# Altium project Carrier-Board-v1.0.PrjPcb (part 2 of 9)

## Sheet 03-CAN2_SPI_CAN_CONTROLLER.SchDoc
size A4; SheetNumber: 4; SheetTotal: 20
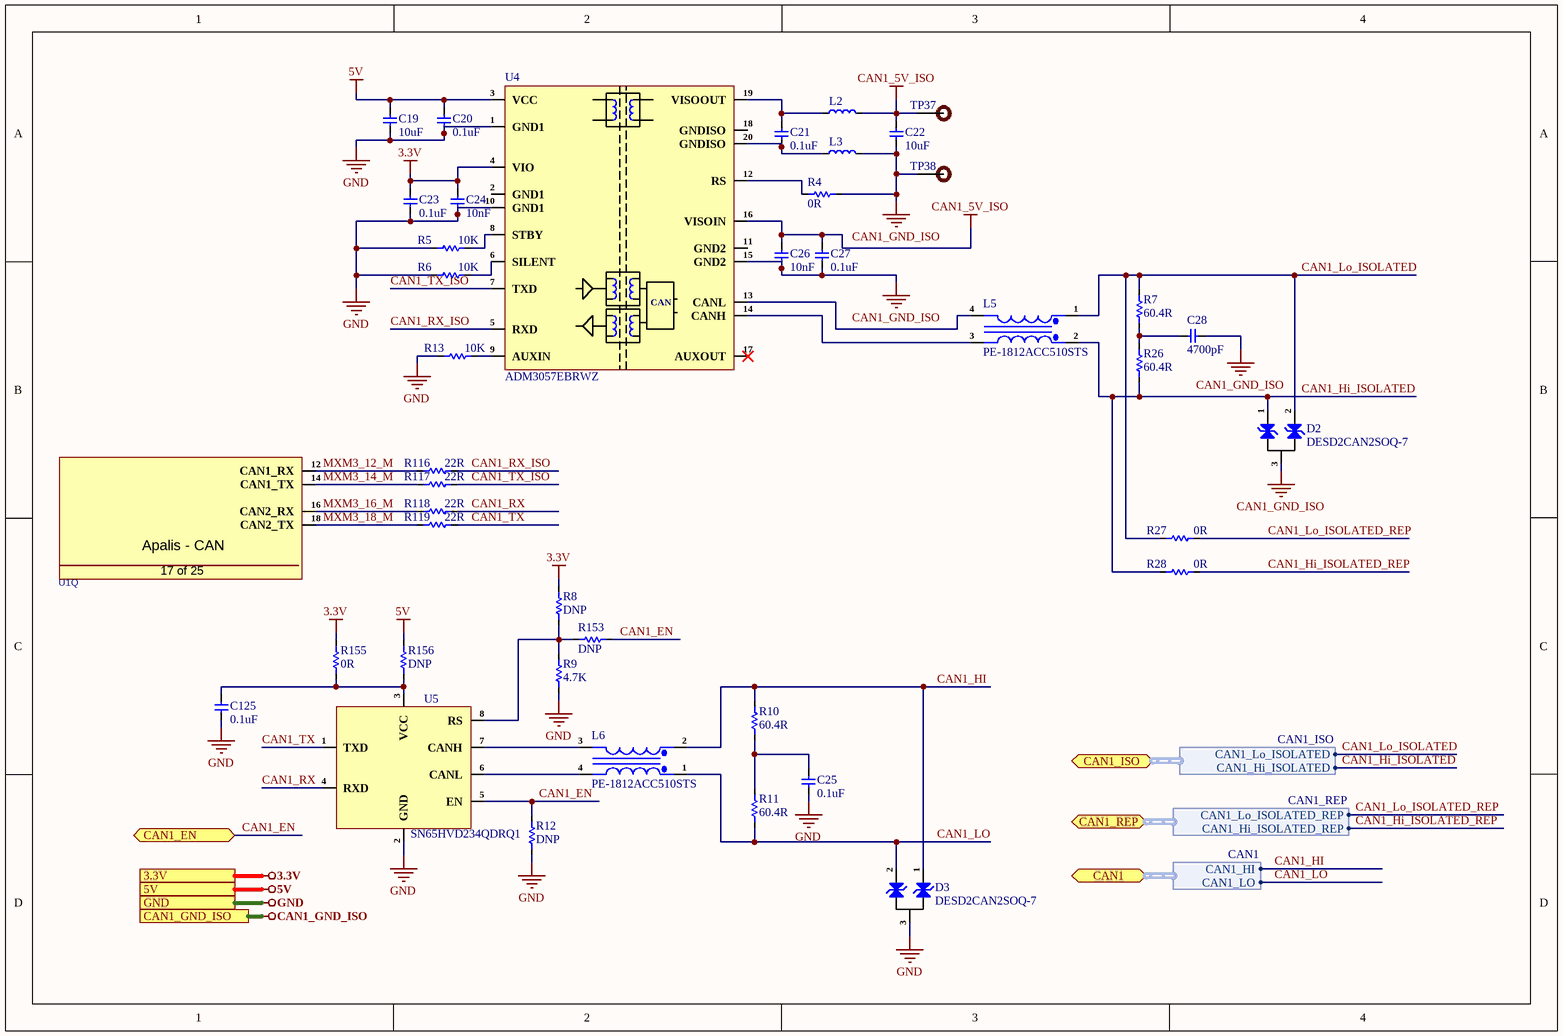
[diagram p3: 03-CAN2_SPI_CAN_CONTROLLER.SchDoc]

### Parts
C19  10uF  [Cap-0603]
C20  0.1uF  [Cap-0402]
C21  0.1uF  [Cap-0402]
C22  10uF  [Cap-0603]
C23  0.1uF  [Cap-0402]
C24  10nF  [Cap-0402]
C25  0.1uF  [Cap-0402]
C26  10nF  [Cap-0402]
C27  0.1uF  [Cap-0402]
C28  4700pF  [Cap-1206]
C125  0.1uF  [Cap-0402]
D2  DESD2CAN2SOQ-7  [SOT-23]
D3  DESD2CAN2SOQ-7  [SOT-23]
L2  BLM15HD182SN1D  [IND-0402]  (value not drawn)
L3  BLM15HD182SN1D  [IND-0402]  (value not drawn)
L5  PE-1812ACC510STS  [PE-1812ACC510STS]
L6  PE-1812ACC510STS  [PE-1812ACC510STS]
R4  0R  [Res-0402]
R5  10K  [Res-0603]
R6  10K  [Res-0603]
R7  60.4R  [Res-0603]
R8  DNP  [Res-0603]
R9  4.7K  [Res-0603]
R10  60.4R  [Res-0603]
R11  60.4R  [Res-0603]
R12  DNP  [Res-0603]
R13  10K  [Res-0603]
R26  60.4R  [Res-0603]
R27  0R  [Res-0603]
R28  0R  [Res-0603]
R116  22R  [Res-0402]
R117  22R  [Res-0402]
R118  22R  [Res-0402]
R119  22R  [Res-0402]
R153  DNP  [Res-0402]
R155  0R  [Res-0603]
R156  DNP  [Res-0603]
TP37  DNP  [Test-point]  (value not drawn)
TP38  DNP  [Test-point]  (value not drawn)
U1  MM70-314B1-2-R300  [MM70-314B1-2-R300]  (value not drawn)  (part Q of 25)
U4  ADM3057EBRWZ  [20-SOIC]
U5  SN65HVD234QDRQ1  [SOIC-8]

### Ports
3.3V (see Top_Sheet[1B], APALIS_POWER_SUPPLY[1D], CAN2_SPI_CAN_CONTROLLER[1D], DC_DC_CONVERTER[1D], GPIO_NC_INTERFACE[4B], I2C_INTERFACE[1B], LTE_MODULE[1D], Reset_and_SDIO[1D]), 5V (see Top_Sheet[1B], CAN2_SPI_CAN_CONTROLLER[1D], DC_DC_CONVERTER[1D]), CAN1 (bidir, harness CAN1, see Top_Sheet[1B], CONNECTORS[2C]), CAN1_EN (bidir, see Top_Sheet[1B], GPIO_NC_INTERFACE[3D]), CAN1_GND_ISO (see Top_Sheet[1B], CONNECTORS[1D]), CAN1_ISO (bidir, harness CAN1_ISO, see Top_Sheet[1B], CONNECTORS[3B]), CAN1_REP (bidir, harness CAN1_REP, see Top_Sheet[1B], CONNECTORS[3C]), GND (see Top_Sheet[1B], APALIS_POWER_SUPPLY[1D], CAN2_SPI_CAN_CONTROLLER[1D], CODEC_INTERFACE[1D], CONNECTORS[1D], DC_DC_CONVERTER[1D], DIGITAL_I-O_O-P[1D], ETHERNET_INTERFACE[1D], FUTURE_USE_CONNECTOR[1D], GPIO_NC_INTERFACE[4B], HDMI_INTERFACE[1D], I2C_INTERFACE[1B], INPUT_SUPPLY_PROTECTION[1D], LTE_MODULE[1D], MECHANICAL_FOR_PCB[1D], MICRO_SD_CARD_INTERFACE[1D], Reset_and_SDIO[1D], UART_INTERFACE[1D], USB3.0_INTERFACE[1D])

### Harnesses
CAN1_ISO: CAN1_Lo_ISOLATED, CAN1_Hi_ISOLATED
CAN1_REP: CAN1_Lo_ISOLATED_REP, CAN1_Hi_ISOLATED_REP
CAN1: CAN1_HI, CAN1_LO

### Nets
3.3V: C23.2 C24.2 R8.2 R155.2 U4.4(VIO) ; port 3.3V
5V: C19.2 C20.2 R156.2 U4.3(VCC) ; port 5V
CAN1_5V_ISO: C22.2 C26.2 C27.2 L2.2 TP37.1 U4.16(VISOIN)
CAN1_GND_ISO: C22.1 C26.1 C27.1 C28.2 D2.3 L3.2 R4.2 TP38.1 U4.15(GND2) ; port CAN1_GND_ISO
GND: C19.1 C20.1 C23.1 C24.1 C25.1 C125.1 D3.3 R5.1 R6.1 R9.1 R12.1 R13.1 U4.1(GND1) U4.10(GND1) U5.2(GND) ; port GND
CAN1_EN: R12.2 R153.2 U5.5(EN) ; port CAN1_EN
CAN1_HI: D3.1 L6.2 R10.2 ; port CAN1.CAN1_HI  [project net CAN1.CAN1_HI]
CAN1_Hi_ISOLATED: D2.1 L5.2 R26.1 R28.2 ; port CAN1_ISO.CAN1_Hi_ISOLATED
CAN1_Hi_ISOLATED_REP: R28.1 ; port CAN1_REP.CAN1_Hi_ISOLATED_REP
CAN1_LO: D3.2 L6.1 R11.1 ; port CAN1.CAN1_LO  [project net CAN1.CAN1_LO]
CAN1_Lo_ISOLATED: D2.2 L5.1 R7.2 R27.2 ; port CAN1_ISO.CAN1_Lo_ISOLATED  [project net CAN1_ISO.CAN1_Lo_ISOLATED]
CAN1_Lo_ISOLATED_REP: R27.1 ; port CAN1_REP.CAN1_Lo_ISOLATED_REP
CAN1_RX: R118.2 U5.4(RXD)
CAN1_RX_ISO: R116.2 U4.5(RXD)
CAN1_TX: R119.2 U5.1(TXD)
CAN1_TX_ISO: R117.2 U4.7(TXD)
MXM3_12_M: R116.1 U1.12(CAN1_RX)
MXM3_14_M: R117.1 U1.14(CAN1_TX)
MXM3_16_M: R118.1 U1.16(CAN2_RX)
MXM3_18_M: R119.1 U1.18(CAN2_TX)
NetC21_1: C21.1 L3.1 U4.20(GNDISO)
NetC21_2: C21.2 L2.1 U4.19(VISOOUT)
NetC25_2: C25.2 R10.1 R11.2
NetC28_1: C28.1 R7.1 R26.2
NetC125_2: C125.2 R155.1 R156.1 U5.3(VCC)
NetL5_3: L5.3 U4.14(CANH)
NetL5_4: L5.4 U4.13(CANL)
NetL6_3: L6.3 U5.7(CANH)
NetL6_4: L6.4 U5.6(CANL)
NetR4_1: R4.1 U4.12(RS)
NetR5_2: R5.2 U4.8(STBY)
NetR6_2: R6.2 U4.6(SILENT)
NetR8_1: R8.1 R9.2 R153.1 U5.8(RS)
NetR13_2: R13.2 U4.9(AUXIN)

Not connected (* = marked no-connect by the designer): U4 2(GND1) 11(GND2) 17(AUXOUT)* 18(GNDISO)

### Notes on the sheet
- (in symbol ADM3057EBRWZ) CAN
- (in symbol MM70-314B1-2-R300, part Q) Apalis - CAN; 17 of 25

### Library data of the parts
C19 C22 = GRM188R61A106KE69D: CAP CER 10UF 10V X5R 0603; Manufacturer: Murata; Tolerance: 10%; Item Type: Capacitor; Supplier: Future Electronics; Supplier Part Number: 1008140; Manufacturer Part Number: GRM188R61A106KE69D; RoHS: Yes; Category: Ceramic Capacitors; Stock: 36000; Pricing: 4000=0.0237, 12000=0.0228, 20000=0.0224, 60000=0.0216, 100000=0.0209 (USD); Mounting Technology: Surface Mount; Case/Package: 0603; Case Code (Metric): 1608; Case Code (Imperial): 0603; Min Operating Temperature: -55°C; Max Operating Temperature: 85°C; Value: 10uF; Packaging: Cut Tape; Dielectric: X5R; Voltage Rating: 10V; Voltage: 10V; Voltage Rating (DC): 10V; Series: GRM; Length: 0.063inch; Width: 0.031inch; Height: 0.8mm; Thickness: 0.037inch; Depth: 0.8mm; Reach SVHC Compliant: No; Lead Free: Lead Free; RoHS Compliant: Yes; ComponentLink1URL: http://www.farnell.com/datasheets/1955682.pdf?src-supplier=Farnell; ComponentLink1Description: http://www.farnell.com/datasheets/1955682.pdf?src-supplier=Farnell; ComponentLink2URL: http://www.mouser.com/ds/2/281/c02e-2905.pdf?src-supplier=Mouser; ComponentLink2Description: http://www.mouser.com/ds/2/281/c02e-2905.pdf?src-supplier=Mouser; ComponentLink3URL: http://www.farnell.com/datasheets/1955682.pdf?src-supplier=Newark; ComponentLink3Description: http://www.farnell.com/datasheets/1955682.pdf?src-supplier=Newark; ComponentLink4URL: http://www.farnell.com/datasheets/1955682.pdf?src-supplier=Element14; ComponentLink4Description: http://www.farnell.com/datasheets/1955682.pdf?src-supplier=Element14; ComponentLink5URL: https://datasheet.octopart.com/GRM188R61A106KE69D-Murata-datasheet-46741888.pdf?src-supplier=Element14; ComponentLink5Description: https://datasheet.octopart.com/GRM188R61A106KE69D-Murata-datasheet-46741888.pdf?src-supplier=Element14; ComponentLink6URL: http://search.murata.co.jp/Ceramy/image/img/A01X/G101/ENG/GRM188R61A106KE69-01.pdf?src-supplier=Digi-Key; ComponentLink6Description: http://search.murata.co.jp/Ceramy/image/img/A01X/G101/ENG/GRM188R61A106KE69-01.pdf?src-supplier=Digi-Key; ComponentLink7URL: http://psearch.en.murata.com/capacitor/product/GRM188R61A106KE69%23.pdf?src-supplier=Avnet; ComponentLink7Description: http://psearch.en.murata.com/capacitor/product/GRM188R61A106KE69%23.pdf?src-supplier=Avnet
C20 C21 C23 C25 C27 C125 = C0402C104K4REC7867: as C7 on sheet APALIS_POWER_SUPPLY; Supplier: Digi-Key; Supplier Part Number: 399-C0402C104K4REC7867CT-ND; Manufacturer Part Number: C0402C104K4REC7867; RoHS: No; Category: Ceramic Capacitors; Stock: 10918; Pricing: 1=0.1, 10=0.072, 50=0.0408, 100=0.0338, 500=0.02372, 1000=0.01963, 2500=0.01827, 5000=0.01672 (USD)
C24 C26 = C0402C103K5RAC7411: as C13 on sheet APALIS_POWER_SUPPLY; Supplier: Mouser; Supplier Part Number: 80-C0402C103K5R7411; Manufacturer Part Number: C0402C103K5RAC7411; RoHS: Yes; Category: Ceramic Capacitors; Stock: 440672; Pricing: 1=0.1, 10=0.017, 50=0.017, 100=0.009, 1000=0.005, 10000=0.004 (USD); Mounting Technology: Surface Mount; Case/Package: 0402; Min Operating Temperature: -55°C; Max Operating Temperature: 125°C; Value: 10nF; Dielectric: X7R; Voltage Rating (DC): 50V; Construction: Flat; Length: 1mm; Height: 0.5mm; Depth: 0.5mm; Radiation Hardening: No; RoHS Compliant: Yes; ComponentLink1URL: http://capacitoredge.kemet.com/capedge2/DataSheet?pn=C0402C103K5RAC7411&src-supplier=Avnet; ComponentLink1Description: http://capacitoredge.kemet.com/capedge2/DataSheet?pn=C0402C103K5RAC7411&src-supplier=Avnet
C28 = C1206C472K5RACAUTO: as C15 on sheet CAN2_SPI_CAN_CONTROLLER; Supplier: Mouser; Supplier Part Number: 80-C1206C472K5RAUTO; Manufacturer Part Number: C1206C472K5RACAUTO; RoHS: Yes; Category: Ceramic Capacitors; Stock: 3869; Pricing: 1=0.18, 10=0.075, 50=0.075, 100=0.044, 1000=0.036, 10000=0.028 (USD); ComponentLink1URL: https://datasheet.ciiva.com/6259/datasheetpn-c1206c472k5racauto-6259849.pdf?src-supplier=Digi-Key; ComponentLink1Description: https://datasheet.ciiva.com/6259/datasheetpn-c1206c472k5racauto-6259849.pdf?src-supplier=Digi-Key
D2 D3 = DESD2CAN2SOQ-7: as D1 on sheet CAN2_SPI_CAN_CONTROLLER; Supplier: Future Electronics; Supplier Part Number: 5053887; Manufacturer Part Number: DESD2CAN2SOQ-7; RoHS: Yes; Category: TVS Diodes; Stock: 18000; Pricing: 3000=0.109, 6000=0.107, 12000=0.105, 15000=0.104, 45000=0.101 (USD); Mounting Technology: Surface Mount; Case/Package: TO-236-3; Min Operating Temperature: -65°C; Max Operating Temperature: 150°C; Packaging: Cut Tape; Series: Automotive, AEC-Q101; RoHS Compliant: Yes; ComponentLink1URL: http://www.farnell.com/datasheets/2814365.pdf?src-supplier=Farnell; ComponentLink1Description: http://www.farnell.com/datasheets/2814365.pdf?src-supplier=Farnell; ComponentLink2URL: http://www.mouser.com/ds/2/115/DESD2CAN2SOQ-520157.pdf?src-supplier=Mouser; ComponentLink2Description: http://www.mouser.com/ds/2/115/DESD2CAN2SOQ-520157.pdf?src-supplier=Mouser; ComponentLink3URL: http://www.farnell.com/datasheets/2814365.pdf?src-supplier=Newark; ComponentLink3Description: http://www.farnell.com/datasheets/2814365.pdf?src-supplier=Newark; ComponentLink4URL: http://www.farnell.com/datasheets/2814365.pdf?src-supplier=Element14; ComponentLink4Description: http://www.farnell.com/datasheets/2814365.pdf?src-supplier=Element14; ComponentLink5URL: https://www.diodes.com/assets/Datasheets/DESD2CAN2SOQ.pdf?src-supplier=Digi-Key; ComponentLink5Description: https://www.diodes.com/assets/Datasheets/DESD2CAN2SOQ.pdf?src-supplier=Digi-Key
L2 L3 = BLM15HD182SN1D: FERRITE BEAD 1.8K OHM 0402 1LN; Manufacturer: Murata; Material: Ferrite,Steel; Tolerance: 25%; Impedance: 1.8kR; DC Resistance (DCR): 2.2R; Max DC Current: 200mA; Number of Lines: 1; Test Frequency: 100MHz; Supplier: Rs; Supplier Part Number: 7926224P; Manufacturer Part Number: BLM15HD182SN1D; RoHS: Yes; Category: Ferrite Beads and Chips; Stock: 3975; Pricing: 500=0.057, 1000=0.05, 2500=0.044, 5000=0.04 (GBP); Case/Package: 0402; Pins: 2; Core Material: Ferrite; Case Code (Metric): 1005; Case Code (Imperial): 0402; Min Operating Temperature: -55°C; Max Operating Temperature: 125°C; Package Quantity: 1; Packaging: Tape and Reel; Current Rating: 200mA; Max Current Rating: 200mA; Termination: SMD/SMT; DC Current: 200mA; Number of Circuits: 1; Series: BLM15H; DC Resistance-Max: 2.2R; Length: 1mm; Width: 0.5mm; Height: 0.5mm; Depth: 0.5mm; Radiation Hardening: No; Reach SVHC Compliant: No; Military Standard: Not; Lead Free: Lead Free; RoHS Compliant: Yes; ComponentLink1URL: https://datasheet.ciiva.com/11799/0900766b811b5866-11799012.pdf?src-supplier=Rs; ComponentLink1Description: https://datasheet.ciiva.com/11799/0900766b811b5866-11799012.pdf?src-supplier=Rs; ComponentLink2URL: https://datasheet.ciiva.com/1466/5168-1466912.pdf?src-supplier=Element14; ComponentLink2Description: https://datasheet.ciiva.com/1466/5168-1466912.pdf?src-supplier=Element14; ComponentLink3URL: https://datasheet.ciiva.com/18089/getdatasheetpartid-153054-18089628.pdf?src-supplier=Verical; ComponentLink3Description: https://datasheet.ciiva.com/18089/getdatasheetpartid-153054-18089628.pdf?src-supplier=Verical; ComponentLink4URL: https://datasheet.ciiva.com/41425/001171684-da-01-en-chip-drossel0402-1800r-200ma-1-0x0-5mm-41425786.pdf?src-supplier=Conrad; ComponentLink4Description: https://datasheet.ciiva.com/41425/001171684-da-01-en-chip-drossel0402-1800r-200ma-1-0x0-5mm-41425786.pdf?src-supplier=Conrad; ComponentLink5URL: https://datasheet.ciiva.com/41449/001172201-da-01-en-drossel-0402-1800r-1-0x0-5mm-10000st-41449489.pdf?src-supplier=Conrad; ComponentLink5Description: https://datasheet.ciiva.com/41449/001172201-da-01-en-drossel-0402-1800r-1-0x0-5mm-10000st-41449489.pdf?src-supplier=Conrad; ComponentLink6URL: https://datasheet.ciiva.com/1466/5168-1466911.pdf?src-supplier=Element14; ComponentLink6Description: https://datasheet.ciiva.com/1466/5168-1466911.pdf?src-supplier=Element14; ComponentLink7URL: https://datasheet.ciiva.com/6211/l0110s0101blm15h-6211478.pdf?src-supplier=Digi-Key; ComponentLink7Description: https://datasheet.ciiva.com/6211/l0110s0101blm15h-6211478.pdf?src-supplier=Digi-Key; ComponentLink8URL: https://datasheet.ciiva.com/29985/l0110s0101blm15h-29985212.pdf?src-supplier=Avnet; ComponentLink8Description: https://datasheet.ciiva.com/29985/l0110s0101blm15h-29985212.pdf?src-supplier=Avnet; ComponentLink9URL: https://datasheet.ciiva.com/16420/l0110s0101blm15h-16420767.pdf?src-supplier=Future+Electronics; ComponentLink9Description: https://datasheet.ciiva.com/16420/l0110s0101blm15h-16420767.pdf?src-supplier=Future+Electronics; ComponentLink10URL: https://datasheet.ciiva.com/3081/l0110s0101blm15h-3081606.pdf?src-supplier=Avnet; ComponentLink10Description: https://datasheet.ciiva.com/3081/l0110s0101blm15h-3081606.pdf?src-supplier=Avnet
L5 L6 = PE-1812ACC510STS: as L4 on sheet CAN2_SPI_CAN_CONTROLLER; Supplier: Future Electronics; Supplier Part Number: 5113590; Manufacturer Part Number: PE-1812ACC510STS; RoHS: No
R4 R153 = ERJ-2GE0R00X: as R1 on sheet APALIS_POWER_SUPPLY; Supplier: Mouser; Supplier Part Number: 667-ERJ-2GE0R00X; Manufacturer Part Number: ERJ-2GE0R00X; RoHS: Yes; Category: Chip SMD Resistors; Stock: 10959876; Pricing: 1=0.1, 10=0.013, 50=0.013, 100=0.006, 1000=0.004, 10000=0.003 (USD); Mounting Technology: Surface Mount; Case/Package: 0402; Pins: 2NUMBER; Contact Plating: Tin; Case Code (Metric): 1005; Case Code (Imperial): 0402; Min Operating Temperature: -55°C; Max Operating Temperature: 155°C; Resistor Type: Thick Film; Packaging: Cut Tape; Package Quantity: 10000; Number of Terminations: 2; Termination: SMD/SMT; Max Power Dissipation: 100mW; Voltage Rating (DC): 50V; Features: Automotive AEC-Q200; Series: ERJ; Construction: Rectangular; Technology: THICK FILM; Length: 1mm; Width: 0.5mm; Height: 0.35mm; Depth: 0.5mm; Ratings: AEC-Q200; Radiation Hardening: No; Reach SVHC Compliant: No; Military Standard: Not; Lead Free: Lead Free; RoHS Compliant: Yes; ComponentLink1URL: https://datasheet.ciiva.com/11821/0900766b80f806dd-11821176.pdf?src-supplier=Rs; ComponentLink1Description: https://datasheet.ciiva.com/11821/0900766b80f806dd-11821176.pdf?src-supplier=Rs; ComponentLink2URL: https://datasheet.ciiva.com/46389/1678796-46389518.pdf?src-supplier=Element14; ComponentLink2Description: https://datasheet.ciiva.com/46389/1678796-46389518.pdf?src-supplier=Element14; ComponentLink3URL: https://datasheet.ciiva.com/28695/1678796-28695758.pdf?src-supplier=Element14; ComponentLink3Description: https://datasheet.ciiva.com/28695/1678796-28695758.pdf?src-supplier=Element14; ComponentLink4URL: https://datasheet.ciiva.com/16778/70260739-16778335.pdf?src-supplier=Allied+Electronics; ComponentLink4Description: https://datasheet.ciiva.com/16778/70260739-16778335.pdf?src-supplier=Allied+Electronics; ComponentLink5URL: https://datasheet.ciiva.com/48531/aoa0000ce1-48531077.pdf?src-supplier=Avnet; ComponentLink5Description: https://datasheet.ciiva.com/48531/aoa0000ce1-48531077.pdf?src-supplier=Avnet; ComponentLink6URL: https://datasheet.ciiva.com/30097/4aoa0000ce1-30097116.pdf?src-supplier=Onlinecomponents.com; ComponentLink6Description: https://datasheet.ciiva.com/30097/4aoa0000ce1-30097116.pdf?src-supplier=Onlinecomponents.com; ComponentLink7URL: https://datasheet.ciiva.com/43460/1678796-43460347.pdf?src-supplier=Farnell; ComponentLink7Description: https://datasheet.ciiva.com/43460/1678796-43460347.pdf?src-supplier=Farnell; ComponentLink8URL: https://datasheet.ciiva.com/5959/1678796-5959692.pdf?src-supplier=Farnell; ComponentLink8Description: https://datasheet.ciiva.com/5959/1678796-5959692.pdf?src-supplier=Farnell; ComponentLink9URL: https://datasheet.ciiva.com/16783/70260739-16783734.pdf?src-supplier=Allied+Electronics; ComponentLink9Description: https://datasheet.ciiva.com/16783/70260739-16783734.pdf?src-supplier=Allied+Electronics
R5 R6 R13 = RCA060310K0FKEAHP: as R126 on sheet APALIS_POWER_SUPPLY; Supplier: Future Electronics; Supplier Part Number: 4171415; Manufacturer Part Number: RCA060310K0FKEAHP; RoHS: Yes; Category: Chip SMD Resistors; Stock: 10000; Pricing: 5000=0.0413, 10000=0.0403, 15000=0.0397, 25000=0.0389, 50000=0.0374 (USD); Case/Package: 0603; Case Code (Imperial): 0603; Case Code (Metric): 1608; Min Operating Temperature: -55°C; Max Operating Temperature: 155°C; Features: Automotive AEC-Q200,Anti-Sulfur; Packaging: Cut Tape; Tolerance: 1%; Number of Terminations: 2; Series: RCA-HP; Ratings: AEC-Q200; RoHS Compliant: Yes; ComponentLink1URL: http://www.vishay.com/docs/20067/rcahp.pdf?src-supplier=Digi-Key; ComponentLink1Description: http://www.vishay.com/docs/20067/rcahp.pdf?src-supplier=Digi-Key
R7 R10 R11 R26 = RC0603FR-0760R4L: as R2 on sheet CAN2_SPI_CAN_CONTROLLER; Supplier: Rs; Supplier Part Number: 2424164; Manufacturer Part Number: RC0603FR-0760R4L; RoHS: Yes; Category: Chip SMD Resistors; Stock: 8600; Pricing: 100=0.008, 1000=0.007, 2000=0.006 (GBP); ComponentLink1URL: https://datasheet.ciiva.com/12558/rc0603-272842-12558933.pdf?src-supplier=Mouser; ComponentLink1Description: https://datasheet.ciiva.com/12558/rc0603-272842-12558933.pdf?src-supplier=Mouser
R8 R9 R12 = ERA-3AEB472V: RES SMD 4.7K OHM 0.1% 1/10W 0603; Manufacturer: Panasonic; Supplier: Rs; Supplier Part Number: 566888P; Manufacturer Part Number: ERA-3AEB472V; RoHS: Yes; Category: Chip SMD Resistors; Stock: 5210; Pricing: 50=0.242, 100=0.198, 250=0.156, 500=0.114 (GBP); ComponentLink1URL: https://datasheet.ciiva.com/11808/0900766b80fe20f7-11808039.pdf?src-supplier=Rs; ComponentLink1Description: https://datasheet.ciiva.com/11808/0900766b80fe20f7-11808039.pdf?src-supplier=Rs; ComponentLink2URL: https://datasheet.ciiva.com/29183/451124-da-01-en-widerstand-0603-era-29183789.pdf?src-supplier=Conrad; ComponentLink2Description: https://datasheet.ciiva.com/29183/451124-da-01-en-widerstand-0603-era-29183789.pdf?src-supplier=Conrad; ComponentLink3URL: https://datasheet.ciiva.com/22743/485442-22743061.pdf?src-supplier=Element14; ComponentLink3Description: https://datasheet.ciiva.com/22743/485442-22743061.pdf?src-supplier=Element14; ComponentLink4URL: https://datasheet.ciiva.com/46422/485442-46422693.pdf?src-supplier=Element14; ComponentLink4Description: https://datasheet.ciiva.com/46422/485442-46422693.pdf?src-supplier=Element14; ComponentLink5URL: https://datasheet.ciiva.com/30078/54aoa0000ce26-30078815.pdf?src-supplier=Onlinecomponents.com; ComponentLink5Description: https://datasheet.ciiva.com/30078/54aoa0000ce26-30078815.pdf?src-supplier=Onlinecomponents.com; ComponentLink6URL: https://datasheet.ciiva.com/16772/70068849-16772572.pdf?src-supplier=Allied+Electronics; ComponentLink6Description: https://datasheet.ciiva.com/16772/70068849-16772572.pdf?src-supplier=Allied+Electronics; ComponentLink7URL: https://datasheet.ciiva.com/48425/era-eng-tds-48425470.pdf?src-supplier=Distrelec; ComponentLink7Description: https://datasheet.ciiva.com/48425/era-eng-tds-48425470.pdf?src-supplier=Distrelec; ComponentLink8URL: https://datasheet.ciiva.com/22781/485442-22781497.pdf?src-supplier=Farnell; ComponentLink8Description: https://datasheet.ciiva.com/22781/485442-22781497.pdf?src-supplier=Farnell; ComponentLink9URL: https://datasheet.ciiva.com/43455/485442-43455227.pdf?src-supplier=Farnell; ComponentLink9Description: https://datasheet.ciiva.com/43455/485442-43455227.pdf?src-supplier=Farnell; ComponentLink10URL: https://datasheet.ciiva.com/9117/aoa0000ce26-9117707.pdf?src-supplier=Avnet; ComponentLink10Description: https://datasheet.ciiva.com/9117/aoa0000ce26-9117707.pdf?src-supplier=Avnet; ComponentLink11URL: https://datasheet.ciiva.com/9116/aoa0000ce26-9116681.pdf?src-supplier=Avnet; ComponentLink11Description: https://datasheet.ciiva.com/9116/aoa0000ce26-9116681.pdf?src-supplier=Avnet
R27 R28 R155 = ERJ-3GEY0R00V: RES SMD 0 OHM JUMPER 1/10W 0603; Manufacturer: Panasonic; Power Rating: 100mW; Voltage Rating: 75V; Tolerance: 0%; Temperature Coefficient: 200ppm/°C; Voltage Rating (DC): 50V; Supplier: Mouser; Supplier Part Number: 667-ERJ-3GEY0R00V; Manufacturer Part Number: ERJ-3GEY0R00V; RoHS: Yes; Category: Chip SMD Resistors; Stock: 9094861; Pricing: 1=0.1, 10=0.044, 50=0.044, 100=0.019, 1000=0.008, 5000=0.006, 10000=0.004 (USD); Mounting Technology: Surface Mount; Case/Package: 0603; Contact Plating: Tin; Case Code (Metric): 1608; Case Code (Imperial): 0603; Min Operating Temperature: -55°C; Max Operating Temperature: 155°C; Value: 0R; Resistor Type: Thick Film; Packaging: Tape and Reel; Package Quantity: 5000; Number of Terminations: 2; Termination: SMD/SMT; Max Power Dissipation: 100mW; Features: Automotive AEC-Q200; Series: ERJ; Construction: Rectangular; Technology: THICK FILM; Length: 1.6mm; Width: 0.8mm; Height: 0.45mm; Depth: 0.8mm; Ratings: AEC-Q200; Radiation Hardening: No; Reach SVHC Compliant: No; Military Standard: Not; Lead Free: Lead Free; RoHS Compliant: Yes; ComponentLink1URL: https://datasheet.ciiva.com/27055/1935748-27055113.pdf?src-supplier=Jameco; ComponentLink1Description: https://datasheet.ciiva.com/27055/1935748-27055113.pdf?src-supplier=Jameco; ComponentLink2URL: https://datasheet.ciiva.com/11808/0900766b80f806dd-11808207.pdf?src-supplier=Rs; ComponentLink2Description: https://datasheet.ciiva.com/11808/0900766b80f806dd-11808207.pdf?src-supplier=Rs; ComponentLink3URL: https://datasheet.ciiva.com/46377/1678796-46377868.pdf?src-supplier=Element14; ComponentLink3Description: https://datasheet.ciiva.com/46377/1678796-46377868.pdf?src-supplier=Element14; ComponentLink4URL: https://datasheet.ciiva.com/28695/1678796-28695833.pdf?src-supplier=Element14; ComponentLink4Description: https://datasheet.ciiva.com/28695/1678796-28695833.pdf?src-supplier=Element14; ComponentLink5URL: https://datasheet.ciiva.com/16834/aoa0000ce1-16834828.pdf?src-supplier=Future+Electronics; ComponentLink5Description: https://datasheet.ciiva.com/16834/aoa0000ce1-16834828.pdf?src-supplier=Future+Electronics; ComponentLink6URL: https://datasheet.ciiva.com/48532/aoa0000ce1-48532165.pdf?src-supplier=Avnet; ComponentLink6Description: https://datasheet.ciiva.com/48532/aoa0000ce1-48532165.pdf?src-supplier=Avnet; ComponentLink7URL: https://datasheet.ciiva.com/5959/1678796-5959707.pdf?src-supplier=Farnell; ComponentLink7Description: https://datasheet.ciiva.com/5959/1678796-5959707.pdf?src-supplier=Farnell; ComponentLink8URL: https://datasheet.ciiva.com/16758/70255313-16758527.pdf?src-supplier=Allied+Electronics; ComponentLink8Description: https://datasheet.ciiva.com/16758/70255313-16758527.pdf?src-supplier=Allied+Electronics; ComponentLink9URL: https://datasheet.ciiva.com/9198/aoa0000ce1-9198975.pdf?src-supplier=Avnet; ComponentLink9Description: https://datasheet.ciiva.com/9198/aoa0000ce1-9198975.pdf?src-supplier=Avnet; ComponentLink10URL: https://datasheet.ciiva.com/30199/4aoa0000ce1-30199822.pdf?src-supplier=Onlinecomponents.com; ComponentLink10Description: https://datasheet.ciiva.com/30199/4aoa0000ce1-30199822.pdf?src-supplier=Onlinecomponents.com; ComponentLink11URL: https://datasheet.ciiva.com/43460/1678796-43460647.pdf?src-supplier=Farnell; ComponentLink11Description: https://datasheet.ciiva.com/43460/1678796-43460647.pdf?src-supplier=Farnell
R116-R119 = CRGCQ0402J22R: RES 22 OHM 5% 1/16W 0402; Manufacturer: TE Connectivity; Supplier: Avnet; Supplier Part Number: 73AC8982; Manufacturer Part Number: CRGCQ0402J22R; RoHS: Yes; Category: Chip SMD Resistors; Stock: 20000; Pricing: 1=0.036, 25=0.01, 100=0.008, 250=0.006, 500=0.005 (USD); ComponentLink1URL: https://www.te.com/commerce/DocumentDelivery/DDEController?Action=srchrtrv&amp;DocNm=1773204-3&amp;DocType=DS&amp;DocLang=English&src-supplier=Digi-Key; ComponentLink1Description: https://www.te.com/commerce/DocumentDelivery/DDEController?Action=srchrtrv&amp;DocNm=1773204-3&amp;DocType=DS&amp;DocLang=English&src-supplier=Digi-Key; ComponentLink2URL: https://4donline.ihs.com/images/VipMasterIC/IC/TYEL/TYEL-S-A0004929575/TYEL-S-A0004929575-1.pdf?hkey=52A5661711E402568146F3353EA87419&src-supplier=Newark; ComponentLink2Description: https://4donline.ihs.com/images/VipMasterIC/IC/TYEL/TYEL-S-A0004929575/TYEL-S-A0004929575-1.pdf?hkey=52A5661711E402568146F3353EA87419&src-supplier=Newark; ComponentLink3URL: https://4donline.ihs.com/images/VipMasterIC/IC/TYEL/TYEL-S-A0004929575/TYEL-S-A0004929575-1.pdf?hkey=52A5661711E402568146F3353EA87419&src-supplier=Element14; ComponentLink3Description: https://4donline.ihs.com/images/VipMasterIC/IC/TYEL/TYEL-S-A0004929575/TYEL-S-A0004929575-1.pdf?hkey=52A5661711E402568146F3353EA87419&src-supplier=Element14; ComponentLink4URL: https://datasheet.octopart.com/CRGCQ0402J22R-TE-Connectivity-datasheet-114679081.pdf?src-supplier=Master+Electronics; ComponentLink4Description: https://datasheet.octopart.com/CRGCQ0402J22R-TE-Connectivity-datasheet-114679081.pdf?src-supplier=Master+Electronics
R156 = ERJ-3GEY0R00V: RES SMD 0 OHM JUMPER 1/10W 0603; Manufacturer: Panasonic; Value: 0R; Power Rating: 100mW; Voltage Rating: 75V; Tolerance: 0%; Temperature Coefficient: 200ppm/°C; Voltage Rating (DC): 50V; Supplier: Mouser; Supplier Part Number: 667-ERJ-3GEY0R00V; Manufacturer Part Number: ERJ-3GEY0R00V; RoHS: Yes; Category: Chip SMD Resistors; Stock: 9094861; Pricing: 1=0.1, 10=0.044, 50=0.044, 100=0.019, 1000=0.008, 5000=0.006, 10000=0.004 (USD); Mounting Technology: Surface Mount; Case/Package: 0603; Contact Plating: Tin; Case Code (Metric): 1608; Case Code (Imperial): 0603; Min Operating Temperature: -55°C; Max Operating Temperature: 155°C; Resistor Type: Thick Film; Packaging: Tape and Reel; Package Quantity: 5000; Number of Terminations: 2; Termination: SMD/SMT; Max Power Dissipation: 100mW; Features: Automotive AEC-Q200; Series: ERJ; Construction: Rectangular; Technology: THICK FILM; Length: 1.6mm; Width: 0.8mm; Height: 0.45mm; Depth: 0.8mm; Ratings: AEC-Q200; Radiation Hardening: No; Reach SVHC Compliant: No; Military Standard: Not; Lead Free: Lead Free; RoHS Compliant: Yes; ComponentLink1URL: https://datasheet.ciiva.com/27055/1935748-27055113.pdf?src-supplier=Jameco; ComponentLink1Description: https://datasheet.ciiva.com/27055/1935748-27055113.pdf?src-supplier=Jameco; ComponentLink2URL: https://datasheet.ciiva.com/11808/0900766b80f806dd-11808207.pdf?src-supplier=Rs; ComponentLink2Description: https://datasheet.ciiva.com/11808/0900766b80f806dd-11808207.pdf?src-supplier=Rs; ComponentLink3URL: https://datasheet.ciiva.com/46377/1678796-46377868.pdf?src-supplier=Element14; ComponentLink3Description: https://datasheet.ciiva.com/46377/1678796-46377868.pdf?src-supplier=Element14; ComponentLink4URL: https://datasheet.ciiva.com/28695/1678796-28695833.pdf?src-supplier=Element14; ComponentLink4Description: https://datasheet.ciiva.com/28695/1678796-28695833.pdf?src-supplier=Element14; ComponentLink5URL: https://datasheet.ciiva.com/16834/aoa0000ce1-16834828.pdf?src-supplier=Future+Electronics; ComponentLink5Description: https://datasheet.ciiva.com/16834/aoa0000ce1-16834828.pdf?src-supplier=Future+Electronics; ComponentLink6URL: https://datasheet.ciiva.com/48532/aoa0000ce1-48532165.pdf?src-supplier=Avnet; ComponentLink6Description: https://datasheet.ciiva.com/48532/aoa0000ce1-48532165.pdf?src-supplier=Avnet; ComponentLink7URL: https://datasheet.ciiva.com/5959/1678796-5959707.pdf?src-supplier=Farnell; ComponentLink7Description: https://datasheet.ciiva.com/5959/1678796-5959707.pdf?src-supplier=Farnell; ComponentLink8URL: https://datasheet.ciiva.com/16758/70255313-16758527.pdf?src-supplier=Allied+Electronics; ComponentLink8Description: https://datasheet.ciiva.com/16758/70255313-16758527.pdf?src-supplier=Allied+Electronics; ComponentLink9URL: https://datasheet.ciiva.com/9198/aoa0000ce1-9198975.pdf?src-supplier=Avnet; ComponentLink9Description: https://datasheet.ciiva.com/9198/aoa0000ce1-9198975.pdf?src-supplier=Avnet; ComponentLink10URL: https://datasheet.ciiva.com/30199/4aoa0000ce1-30199822.pdf?src-supplier=Onlinecomponents.com; ComponentLink10Description: https://datasheet.ciiva.com/30199/4aoa0000ce1-30199822.pdf?src-supplier=Onlinecomponents.com; ComponentLink11URL: https://datasheet.ciiva.com/43460/1678796-43460647.pdf?src-supplier=Farnell; ComponentLink11Description: https://datasheet.ciiva.com/43460/1678796-43460647.pdf?src-supplier=Farnell
TP37 TP38 = TEST POINT: Test Point ON; Item Type: TEST POINT
U1 = MM70-314B1-2-R300: as U1 on sheet APALIS_POWER_SUPPLY; Supplier: Digi-Key; Supplier Part Number: 670-MM70-314B1-2-R300CT-ND; Manufacturer Part Number: MM70-314B1-2-R300; RoHS: No; Category: Card Edge Connectors; Stock: 4979; Pricing: 1=9.21, 10=8.287, 25=7.8064, 50=7.6064, 100=7.4062 (USD)
U4 = ADM3057EBRWZ: IC TXRX/ISO 1/1 20SOIC; Manufacturer: Analog Devices; Supplier: Mouser; Supplier Part Number: 584-ADM3057EBRWZ; Manufacturer Part Number: ADM3057EBRWZ; RoHS: Yes; Category: Interface ICs; Stock: 9176; Pricing: 1=13.72, 10=12.62, 50=12.09, 100=12.09, 1000=9.47, 10000=9.47 (USD); Series: *; RoHS Compliant: Yes; ComponentLink1URL: https://www.analog.com/media/en/technical-documentation/data-sheets/ADM3055E-3057E.pdf?src-supplier=Digi-Key; ComponentLink1Description: https://www.analog.com/media/en/technical-documentation/data-sheets/ADM3055E-3057E.pdf?src-supplier=Digi-Key
U5 = SN65HVD234QDRQ1: IC TRANSCEIVER HALF 1/1 8SOIC; Manufacturer: Texas Instruments; Supplier: Digi-Key; Supplier Part Number: 296-44804-1-ND; Manufacturer Part Number: SN65HVD234QDRQ1; RoHS: Yes; Category: Interface ICs; Pricing: 1=3.57, 10=3.209, 25=3.0336, 100=2.6293, 250=2.49444, 500=2.23826, 1000=1.88769 (USD); ComponentLink1URL: http://www.ti.com/general/docs/suppproductinfo.tsp?distId=10&amp;gotoUrl=http%3A%2F%2Fwww.ti.com%2Flit%2Fgpn%2Fsn65hvd234-q1&src-supplier=Digi-Key; ComponentLink1Description: http://www.ti.com/general/docs/suppproductinfo.tsp?distId=10&amp;gotoUrl=http%3A%2F%2Fwww.ti.com%2Flit%2Fgpn%2Fsn65hvd234-q1&src-supplier=Digi-Key; ComponentLink2URL: http://www.ti.com/general/docs/lit/getliterature.tsp?genericPartNumber=SN65HVD234-Q1&fileType=pdf&src-supplier=Farnell; ComponentLink2Description: http://www.ti.com/general/docs/lit/getliterature.tsp?genericPartNumber=SN65HVD234-Q1&fileType=pdf&src-supplier=Farnell; ComponentLink3URL: http://www.ti.com/lit/ds/symlink/sn65hvd234-q1.pdf?src-supplier=Digi-Key; ComponentLink3Description: http://www.ti.com/lit/ds/symlink/sn65hvd234-q1.pdf?src-supplier=Digi-Key